# Altium schematic sheet 03_Headers-Mesaurements.SchDoc
size A4; SheetNumber: 3; SheetTotal: 3
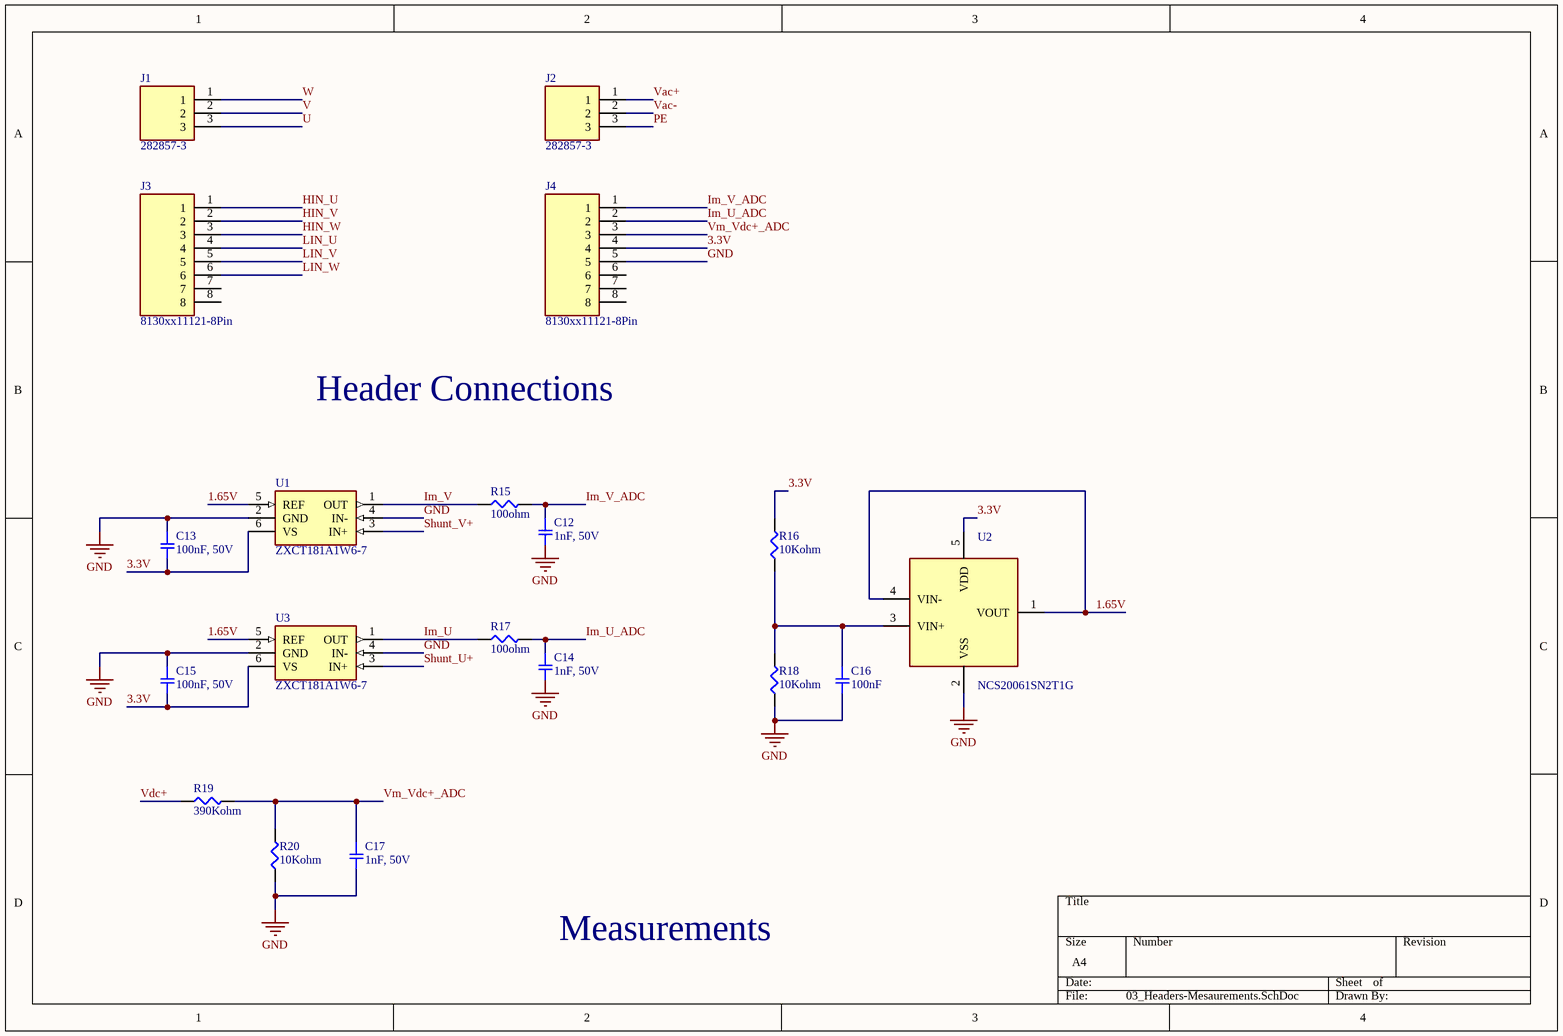
[diagram p0: 03_Headers-Mesaurements.SchDoc]

## Parts
C12  1nF, 50V  [001_SMD-1206]
C13  100nF, 50V  [001_SMD-1206]
C14  1nF, 50V  [001_SMD-1206]
C15  100nF, 50V  [001_SMD-1206]
C16  100nF  [001_SMD-1206]
C17  1nF, 50V  [001_SMD-1206]
J1  282857-3  [201_TE_282857-3]
J2  282857-3  [201_TE_282857-3]
J3  8130xx11121-8Pin  [200_HDRV6W64P0X254_1X6_1524X254X869P]
J4  8130xx11121-8Pin  [200_HDRV6W64P0X254_1X6_1524X254X869P]
R15  100ohm  [001_SMD-1206]
R16  10Kohm  [001_SMD-1206]
R17  100ohm  [001_SMD-1206]
R18  10Kohm  [001_SMD-1206]
R19  390Kohm  [001_SMD-1206]
R20  10Kohm  [001_SMD-1206]
U1  ZXCT181A1W6-7  [896_ZXCT181A1W6-7]
U2  NCS20061SN2T1G  [897_NCS20061SN2T1G]
U3  ZXCT181A1W6-7  [896_ZXCT181A1W6-7]

## Nets
GND: C12.2 C13.1 C14.2 C15.1 C16.2 C17.2 J4.5 R18.1 R20.1 U1.2(GND) U1.4(IN-) U2.2(VSS) U3.2(GND) U3.4(IN-)
1.65V: U1.5(REF) U2.1(VOUT) U2.4(VIN-) U3.5(REF)
3.3V: C13.2 C15.2 J4.4 R16.2 U1.6(VS) U2.5(VDD) U3.6(VS)
HIN_U: J3.1
HIN_V: J3.2
HIN_W: J3.3
Im_U: R17.1 U3.1(OUT)
Im_U_ADC: C14.1 J4.2 R17.2
Im_V: R15.1 U1.1(OUT)
Im_V_ADC: C12.1 J4.1 R15.2
LIN_U: J3.4
LIN_V: J3.5
LIN_W: J3.6
PE: J2.3
Shunt_U+: U3.3(IN+)
Shunt_V+: U1.3(IN+)
U: J1.3
V: J1.2
Vac+: J2.1
Vac-: J2.2
Vdc+: R19.1
Vm_Vdc+_ADC: C17.1 J4.3 R19.2 R20.2
W: J1.1
NetC16_1: C16.1 R16.1 R18.2 U2.3(VIN+)

Not connected (* = marked no-connect by the designer): J3 7 8; J4 6 7 8

## Notes on the sheet
- Header Connections
- Measurements

## Library data of the parts
C12-C17 = C_1206_Template: CAP CER 1206; Part Number: GC321AD72E103KX01D; Manufacturer: Murata Electronics North America; Factory Stock: 0; Unit Price (USD): 0.3; Minimum Quantity: 1; Value: 10000pF; Tolerance: ±10%; Voltage: 250V; Temperature Coefficient: X7T; Datasheets: http://search.murata.co.jp/Ceramy/image/img/A01X/G101/ENG/GC321AD72E103KX01-01.pdf; Image: //media.digikey.com/Renders/Murata%20Renders/0805(GC3)200x125.jpg; Digi-Key Part Number: 490-13986-1-ND; Quantity Available: 4000; @ qty: 0; Packaging: Cut Tape (CT); Series: GC3; Part Status: Active; Operating Temperature: -55°C ~ 125°C; Features: -; Ratings: AEC-Q200; Applications: Automotive; Mounting Type: Surface Mount, MLCC; Package / Case: 0805 (2012 Metric); Size / Dimension: 0.079" L x 0.049" W (2.00mm x 1.25mm); Height - Seated (Max): -; Thickness (Max): 0.039" (1.00mm); Lead Spacing: -; Lead Style: -
J1 J2 = 282857-3: 3 Position Wire to Board Terminal Block Horizontal with Board 0.200 (5.08mm) Through Hole; MF: TE Connectivity; SnapEDA_Link: https://www.snapeda.com/parts/282857-3/TE+Connectivity+AMP+Connectors/view-part/?ref=snap; Package: None; Value: *; MP: 282857-3; EU_RoHS_Compliance: Compliant with Exemptions; Check_prices: https://www.snapeda.com/parts/282857-3/TE+Connectivity+AMP+Connectors/view-part/?ref=eda
J3 J4 = 6130xx11121-6Pin: 2.54MM PIN HEADER; Manufacturer_Name: Wurth Elektronik; Geometry.Height: 8.69mm; Manufacturer_Part_Number: 6130xx11121-6Pin; Mouser Part Number: *; Mouser Price/Stock: *; Arrow Part Number: *; Arrow Price/Stock: *; Datasheet Link: https://www.we-online.com/katalog/datasheet/6130xx11121.pdf
R15-R20 = R_1206_Template: RES SMD 1206; Part Number: ERJ-8BQF1R0V; Manufacturer: Panasonic Electronic Components; Factory Stock: 0; Unit Price (USD): 0.05778; @ qty: 1500; Minimum Quantity: 1; Value: 1; Tolerance: ±1%; Power (Watts): 0.5W, 1/2W; Temperature Coefficient: ±200ppm/°C; Datasheets: https://industrial.panasonic.com/cdbs/www-data/pdf/RDA0000/AOA0000C239.pdf; Image: //media.digikey.com/Renders/Panasonic%20Renders/ERJ-1206%20Pkg.jpg; Digi-Key Part Number: P17600CT-ND; Quantity Available: 2046; Packaging: Cut Tape (CT); Series: ERJ; Part Status: Active; Composition: Thick Film; Features: Automotive AEC-Q200, Current Sense; Operating Temperature: -55°C ~ 125°C; Package / Case: 1206 (3216 Metric); Supplier Device Package: 1206; Size / Dimension: 0.126" L x 0.063" W (3.20mm x 1.60mm); Height - Seated (Max): 0.028" (0.70mm); Number of Terminations: 2; Failure Rate: -
U1 U3 = ZXCT181A1W6-7: Bidirectional high-side current-sense amplifier, fixed gain 20 V/V, 2.7–5.5 V supply, up to 26 V common-mode input range, SOT-26 package.; MF: Texas Instruments; MP: INA181A1IDBVR; SnapEDA_Link: https://www.snapeda.com/parts/INA181A1IDBVR/Texas+Instruments/view-part/?ref=snap; Package: SOT-23-6 Texas Instruments; Value: *; Check_prices: https://www.snapeda.com/parts/INA181A1IDBVR/Texas+Instruments/view-part/?ref=eda
U2 = NCS20061SN2T1G: Single, rail-to-rail operational amplifier used as a voltage buffer for the 1.65 V current-sense reference.